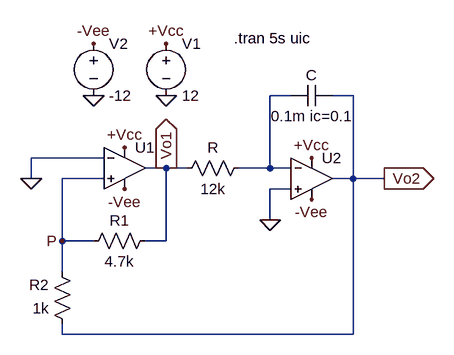
[diagram p0: schematic tri_wave_gen.asc]
tri_wave_gen.asc, the LTspice schematic file:
Version 4.1
SHEET 1 880 680
WIRE 336 64 304 64
WIRE 432 64 400 64
WIRE 48 160 -64 160
WIRE 144 176 112 176
WIRE 176 176 144 176
WIRE 304 176 304 64
WIRE 304 176 256 176
WIRE 336 176 304 176
WIRE -64 192 -64 160
WIRE 48 192 -16 192
WIRE 432 192 432 64
WIRE 432 192 400 192
WIRE 480 192 432 192
WIRE 336 208 304 208
WIRE 304 256 304 208
WIRE -16 288 -16 192
WIRE 32 288 -16 288
WIRE 144 288 144 176
WIRE 144 288 112 288
WIRE -16 336 -16 288
WIRE -16 432 -16 416
WIRE 432 432 432 192
WIRE 432 432 -16 432
FLAG 304 256 0
FLAG -64 192 0
FLAG 80 144 +Vcc
FLAG 368 160 +Vcc
FLAG 144 -16 +Vcc
FLAG 80 208 -Vee
FLAG 368 224 -Vee
FLAG 32 -16 -Vee
FLAG 32 64 0
FLAG 144 64 0
FLAG 480 192 Vo2
IOPIN 480 192 Out
FLAG -16 288 P
FLAG 144 176 Vo1
IOPIN 144 176 Out
SYMBOL OpAmps\\UniversalOpAmp2 80 176 R0
SYMATTR InstName U1
SYMBOL OpAmps\\UniversalOpAmp2 368 192 R0
SYMATTR InstName U2
SYMBOL res 272 160 R90
WINDOW 0 0 56 VBottom 2
WINDOW 3 32 56 VTop 2
SYMATTR InstName R
SYMATTR Value 12k
SYMBOL res 128 272 R90
WINDOW 0 0 56 VBottom 2
WINDOW 3 32 56 VTop 2
SYMATTR InstName R1
SYMATTR Value 4.7k
SYMBOL res 0 432 R180
WINDOW 0 36 76 Left 2
WINDOW 3 36 40 Left 2
SYMATTR InstName R2
SYMATTR Value 1k
SYMBOL cap 400 48 R90
WINDOW 0 0 32 VBottom 2
WINDOW 3 32 32 VTop 2
SYMATTR InstName C
SYMATTR Value 0.1m ic=0.1
SYMBOL voltage 144 -32 R0
WINDOW 123 0 0 Left 0
WINDOW 39 0 0 Left 0
SYMATTR InstName V1
SYMATTR Value 12
SYMBOL voltage 32 -32 R0
WINDOW 123 0 0 Left 0
WINDOW 39 0 0 Left 0
SYMATTR InstName V2
SYMATTR Value -12
TEXT 248 -24 Left 2 !.tran 5s uic

The netlist it stands for:
* tri_wave_gen.asc
X§U1 P 0 +Vcc -Vee Vo1 level2 Avol=1Meg GBW=10Meg Slew=10Meg Ilimit=25m Rail=0 Vos=0 En=0 Enk=0 In=0 Ink=0 Rin=500Meg  ; pins In+ In- V+ V- OUT
X§U2 0 N001 +Vcc -Vee Vo2 level2 Avol=1Meg GBW=10Meg Slew=10Meg Ilimit=25m Rail=0 Vos=0 En=0 Enk=0 In=0 Ink=0 Rin=500Meg  ; pins In+ In- V+ V- OUT
R N001 Vo1 12k
R1 Vo1 P 4.7k
R2 Vo2 P 1k
C Vo2 N001 0.1m ic=0.1
V1 +Vcc 0 12
V2 -Vee 0 -12
.tran 5s uic
.lib UniversalOpAmp2.lib
.backanno
.end